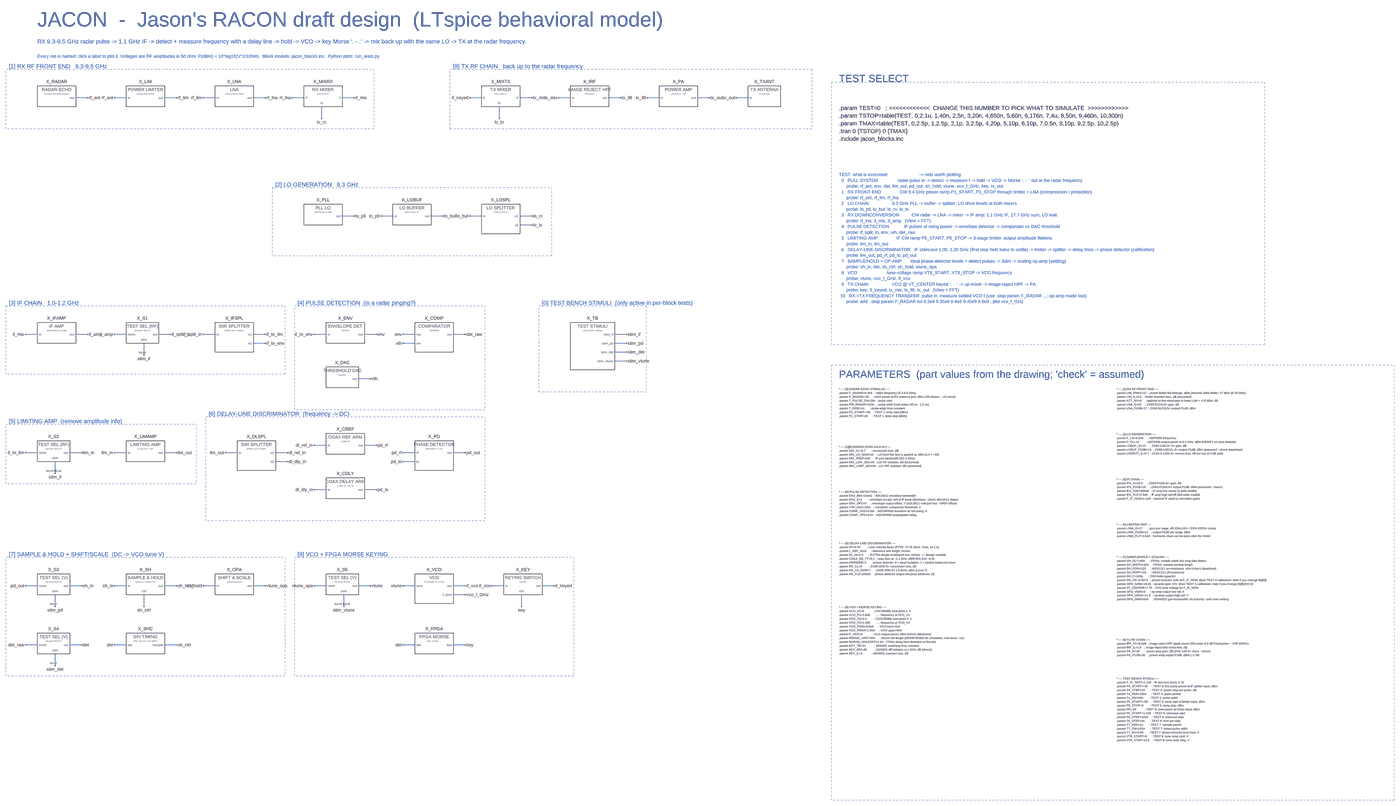
[diagram p0: schematic JACON_system.asc, whole sheet]
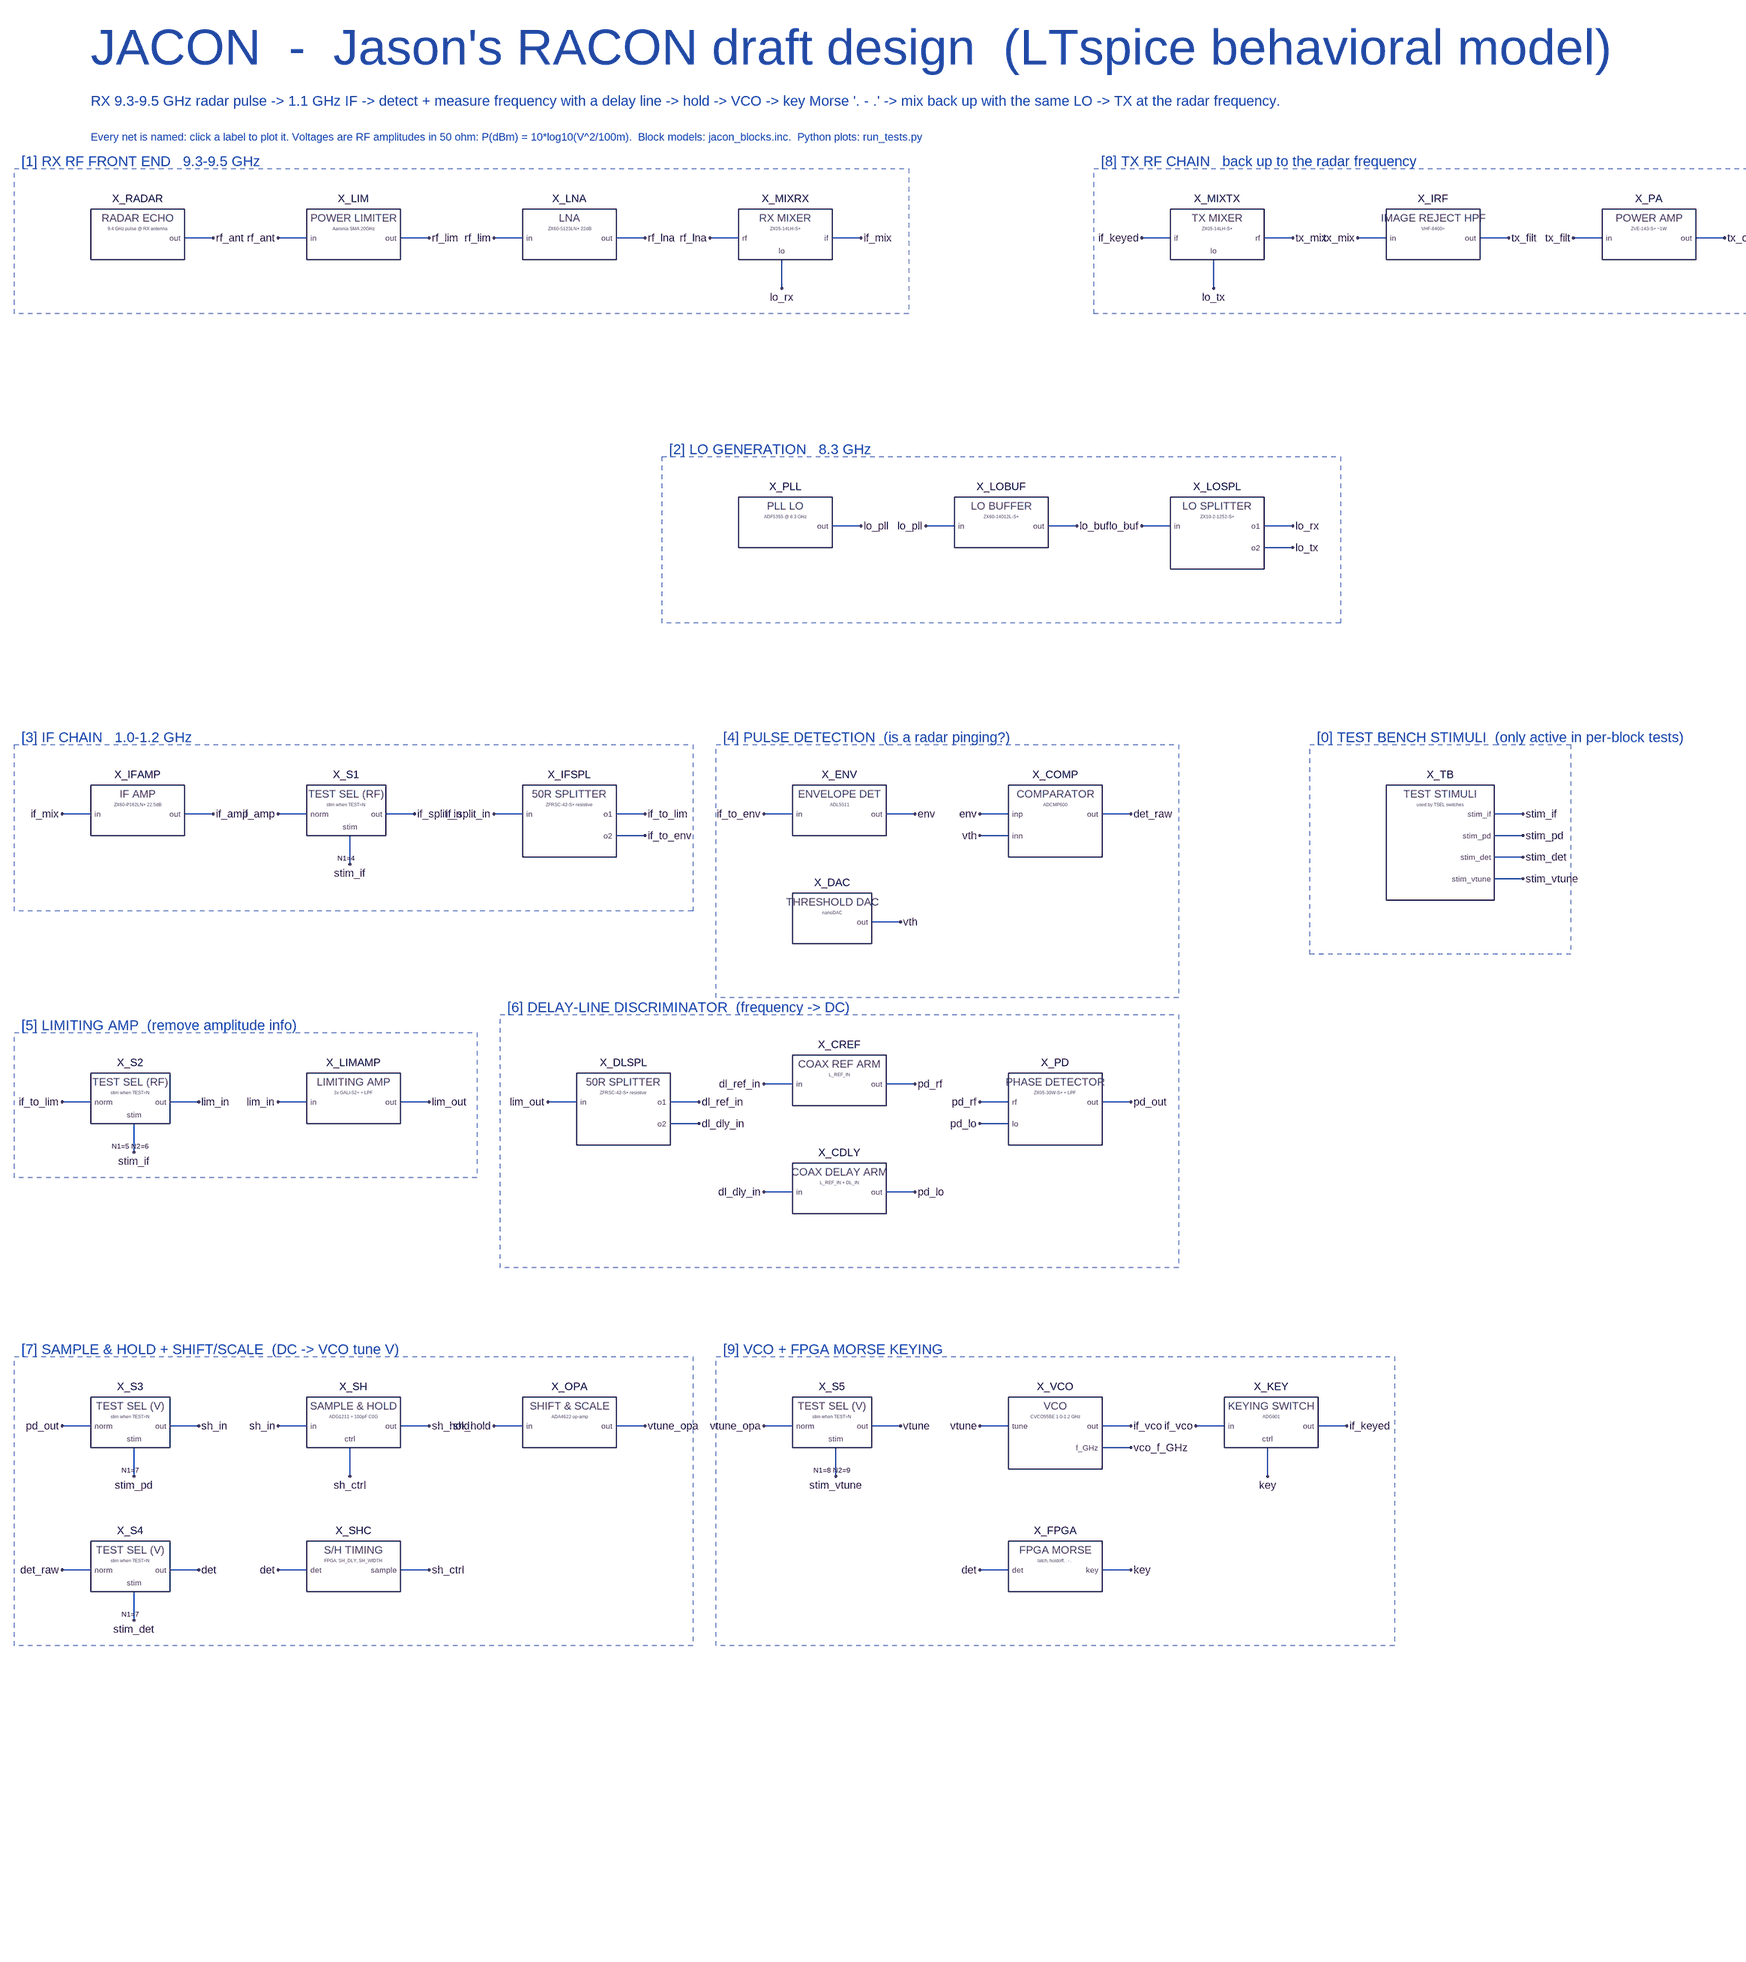
[diagram p1: schematic JACON_system.asc, part, row 1 of 1, column 1 of 2]
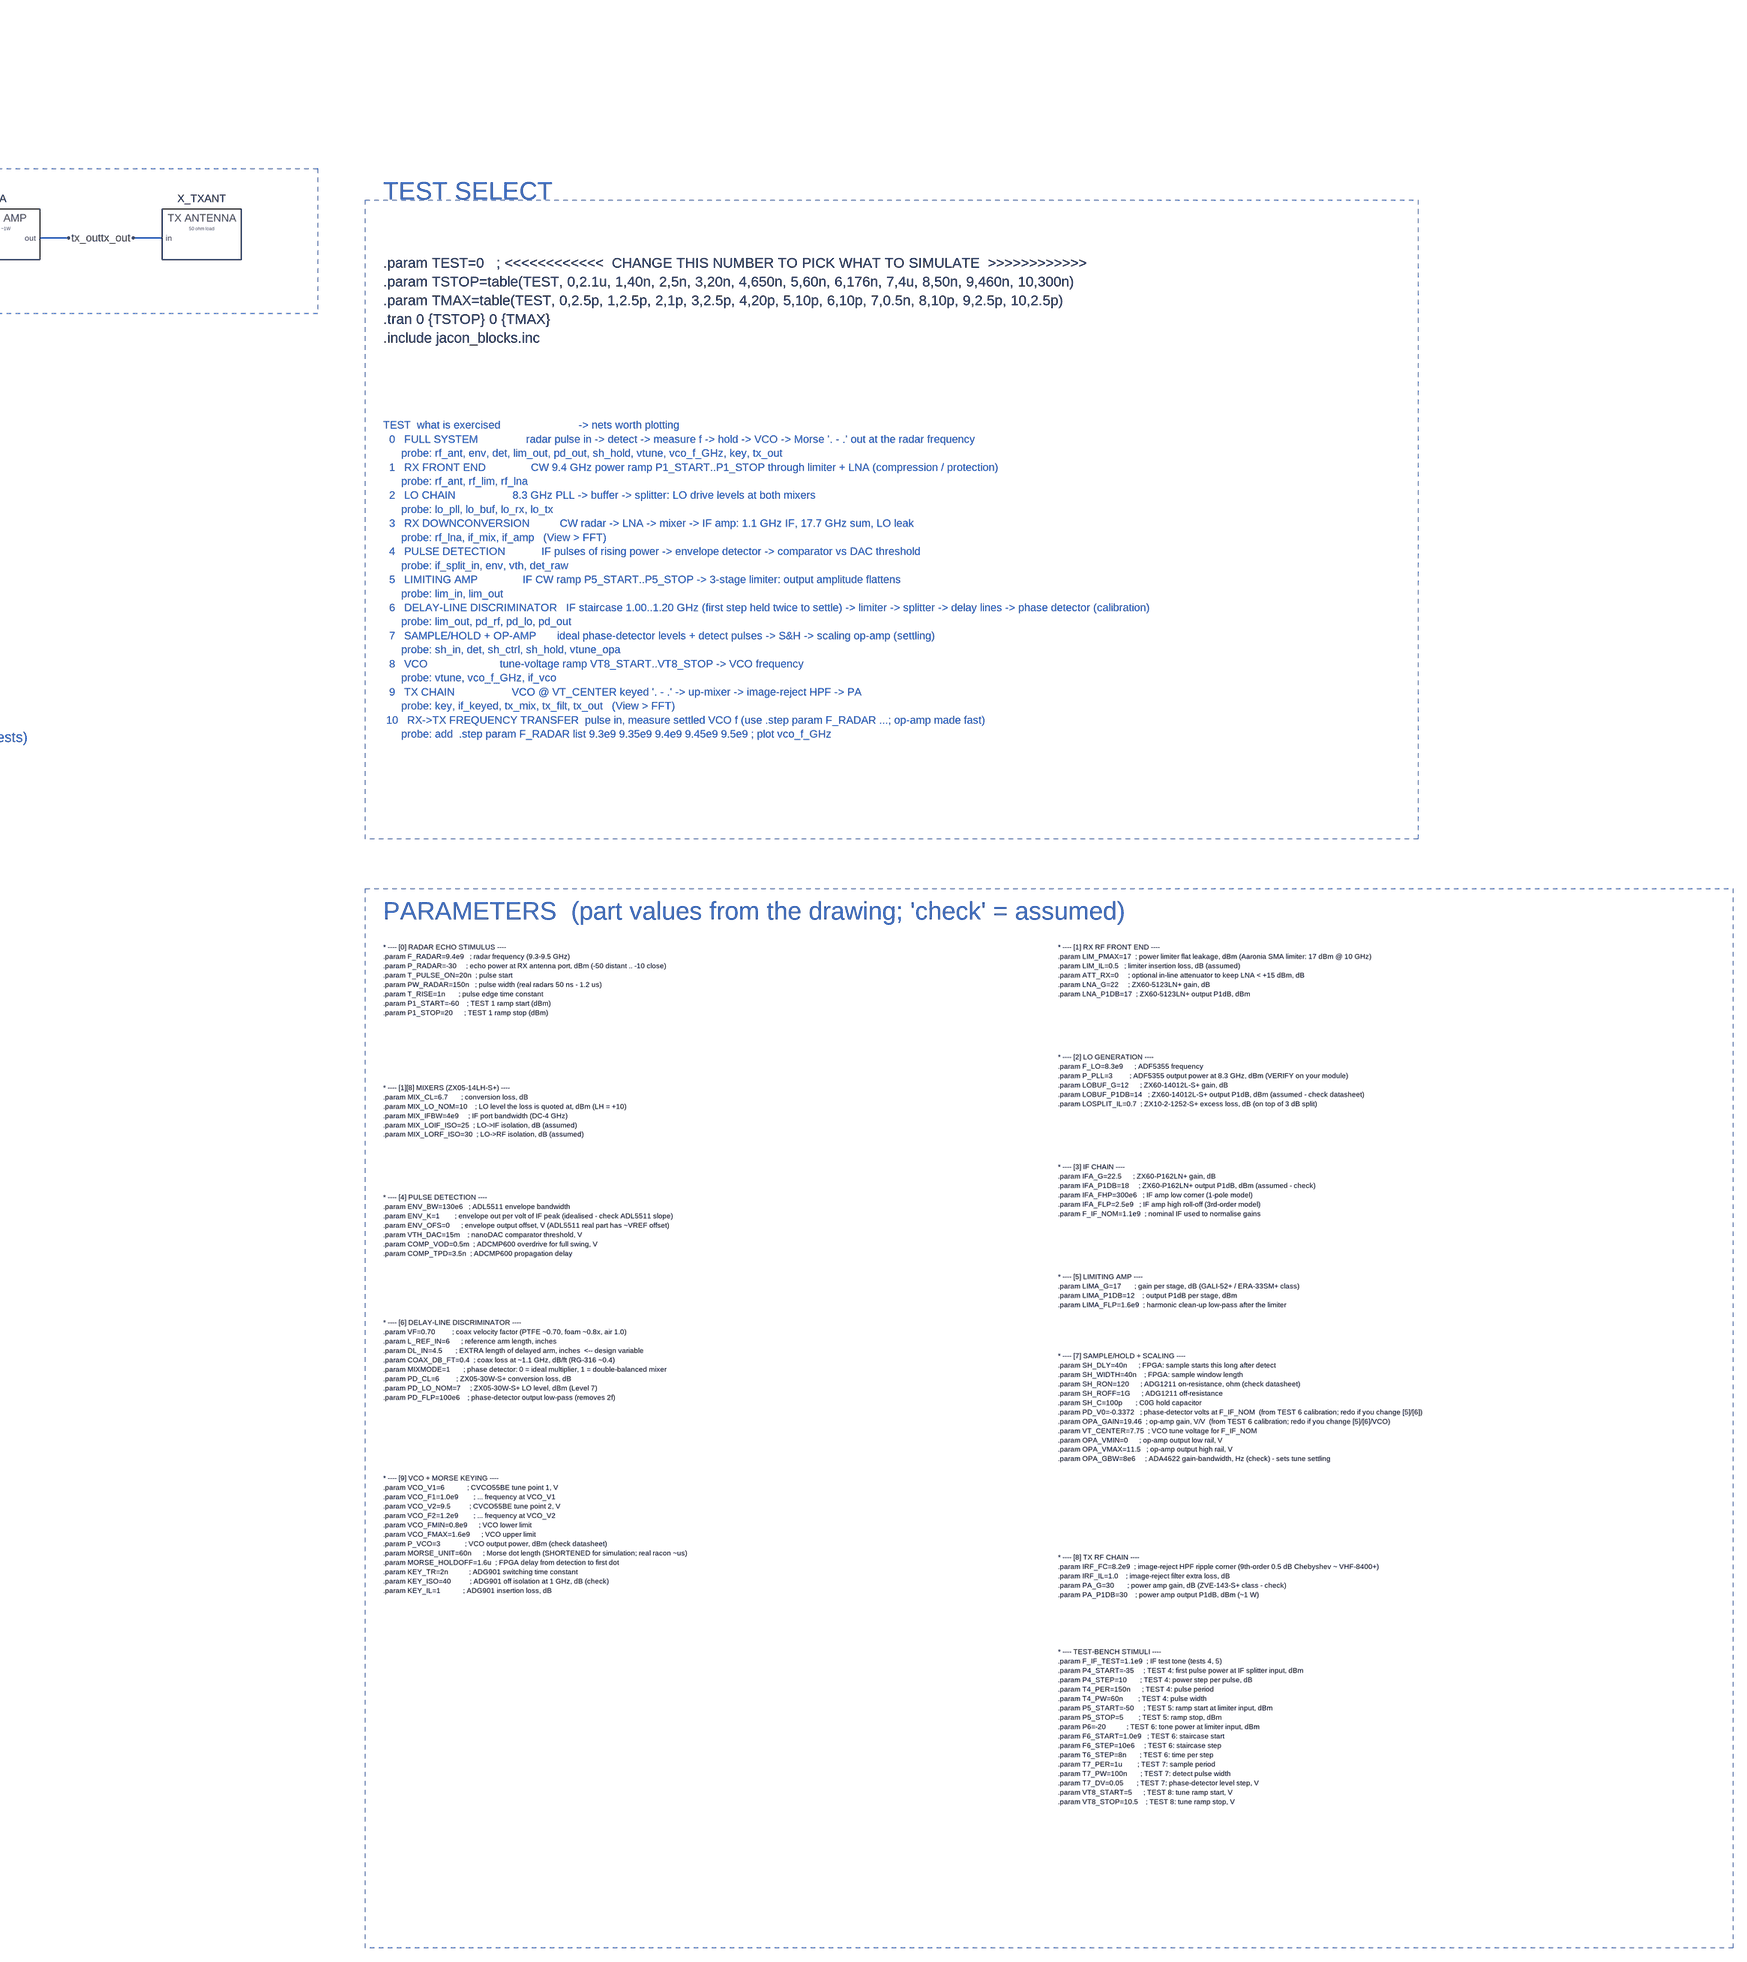
[diagram p2: schematic JACON_system.asc, part, row 1 of 1, column 2 of 2]
JACON_system.asc, the LTspice schematic file:
Version 4
SHEET 1 6400 4400
WIRE 272 64 208 64
FLAG 272 64 rf_ant
SYMBOL jacon_radar_src 0 0 R0
SYMATTR InstName X_RADAR
WIRE 416 64 480 64
FLAG 416 64 rf_ant
WIRE 752 64 688 64
FLAG 752 64 rf_lim
SYMBOL jacon_limiter 480 0 R0
SYMATTR InstName X_LIM
WIRE 896 64 960 64
FLAG 896 64 rf_lim
WIRE 1232 64 1168 64
FLAG 1232 64 rf_lna
SYMBOL jacon_lna 960 0 R0
SYMATTR InstName X_LNA
WIRE 1376 64 1440 64
FLAG 1376 64 rf_lna
WIRE 1712 64 1648 64
FLAG 1712 64 if_mix
WIRE 1536 176 1536 112
FLAG 1536 176 lo_rx
SYMBOL jacon_mix_down 1440 0 R0
SYMATTR InstName X_MIXRX
WIRE 2336 64 2400 64
FLAG 2336 64 if_keyed
WIRE 2672 64 2608 64
FLAG 2672 64 tx_mix
WIRE 2496 176 2496 112
FLAG 2496 176 lo_tx
SYMBOL jacon_mix_up 2400 0 R0
SYMATTR InstName X_MIXTX
WIRE 2816 64 2880 64
FLAG 2816 64 tx_mix
WIRE 3152 64 3088 64
FLAG 3152 64 tx_filt
SYMBOL jacon_img_rej 2880 0 R0
SYMATTR InstName X_IRF
WIRE 3296 64 3360 64
FLAG 3296 64 tx_filt
WIRE 3632 64 3568 64
FLAG 3632 64 tx_out
SYMBOL jacon_pa 3360 0 R0
SYMATTR InstName X_PA
WIRE 3776 64 3840 64
FLAG 3776 64 tx_out
SYMBOL jacon_tx_ant 3840 0 R0
SYMATTR InstName X_TXANT
WIRE 1712 704 1648 704
FLAG 1712 704 lo_pll
SYMBOL jacon_pll_lo 1440 640 R0
SYMATTR InstName X_PLL
WIRE 1856 704 1920 704
FLAG 1856 704 lo_pll
WIRE 2192 704 2128 704
FLAG 2192 704 lo_buf
SYMBOL jacon_lo_buf 1920 640 R0
SYMATTR InstName X_LOBUF
WIRE 2336 704 2400 704
FLAG 2336 704 lo_buf
WIRE 2672 704 2608 704
FLAG 2672 704 lo_rx
WIRE 2672 752 2608 752
FLAG 2672 752 lo_tx
SYMBOL jacon_split_lo 2400 640 R0
SYMATTR InstName X_LOSPL
WIRE -64 1344 0 1344
FLAG -64 1344 if_mix
WIRE 272 1344 208 1344
FLAG 272 1344 if_amp
SYMBOL jacon_if_amp 0 1280 R0
SYMATTR InstName X_IFAMP
WIRE 416 1344 480 1344
FLAG 416 1344 if_amp
WIRE 720 1344 656 1344
FLAG 720 1344 if_split_in
WIRE 576 1456 576 1392
FLAG 576 1456 stim_if
SYMBOL jacon_tsel_rf 480 1280 R0
SYMATTR InstName X_S1
SYMATTR SpiceLine N1=4
WIRE 896 1344 960 1344
FLAG 896 1344 if_split_in
WIRE 1232 1344 1168 1344
FLAG 1232 1344 if_to_lim
WIRE 1232 1392 1168 1392
FLAG 1232 1392 if_to_env
SYMBOL jacon_split_res 960 1280 R0
SYMATTR InstName X_IFSPL
WIRE 1496 1344 1560 1344
FLAG 1496 1344 if_to_env
WIRE 1832 1344 1768 1344
FLAG 1832 1344 env
SYMBOL jacon_env_det 1560 1280 R0
SYMATTR InstName X_ENV
WIRE 1800 1584 1736 1584
FLAG 1800 1584 vth
SYMBOL jacon_dac 1560 1520 R0
SYMATTR InstName X_DAC
WIRE 1976 1344 2040 1344
FLAG 1976 1344 env
WIRE 1976 1392 2040 1392
FLAG 1976 1392 vth
WIRE 2312 1344 2248 1344
FLAG 2312 1344 det_raw
SYMBOL jacon_comparator 2040 1280 R0
SYMATTR InstName X_COMP
WIRE 3184 1344 3120 1344
FLAG 3184 1344 stim_if
WIRE 3184 1392 3120 1392
FLAG 3184 1392 stim_pd
WIRE 3184 1440 3120 1440
FLAG 3184 1440 stim_det
WIRE 3184 1488 3120 1488
FLAG 3184 1488 stim_vtune
SYMBOL jacon_testbench 2880 1280 R0
SYMATTR InstName X_TB
WIRE -64 1984 0 1984
FLAG -64 1984 if_to_lim
WIRE 240 1984 176 1984
FLAG 240 1984 lim_in
WIRE 96 2096 96 2032
FLAG 96 2096 stim_if
SYMBOL jacon_tsel_rf 0 1920 R0
SYMATTR InstName X_S2
SYMATTR SpiceLine N1=5 N2=6
WIRE 416 1984 480 1984
FLAG 416 1984 lim_in
WIRE 752 1984 688 1984
FLAG 752 1984 lim_out
SYMBOL jacon_lim_amp 480 1920 R0
SYMATTR InstName X_LIMAMP
WIRE 1016 1984 1080 1984
FLAG 1016 1984 lim_out
WIRE 1352 1984 1288 1984
FLAG 1352 1984 dl_ref_in
WIRE 1352 2032 1288 2032
FLAG 1352 2032 dl_dly_in
SYMBOL jacon_split_res 1080 1920 R0
SYMATTR InstName X_DLSPL
WIRE 1496 1944 1560 1944
FLAG 1496 1944 dl_ref_in
WIRE 1832 1944 1768 1944
FLAG 1832 1944 pd_rf
SYMBOL jacon_coax_ref 1560 1880 R0
SYMATTR InstName X_CREF
WIRE 1496 2184 1560 2184
FLAG 1496 2184 dl_dly_in
WIRE 1832 2184 1768 2184
FLAG 1832 2184 pd_lo
SYMBOL jacon_coax_dly 1560 2120 R0
SYMATTR InstName X_CDLY
WIRE 1976 1984 2040 1984
FLAG 1976 1984 pd_rf
WIRE 1976 2032 2040 2032
FLAG 1976 2032 pd_lo
WIRE 2312 1984 2248 1984
FLAG 2312 1984 pd_out
SYMBOL jacon_phase_det 2040 1920 R0
SYMATTR InstName X_PD
WIRE -64 2704 0 2704
FLAG -64 2704 pd_out
WIRE 240 2704 176 2704
FLAG 240 2704 sh_in
WIRE 96 2816 96 2752
FLAG 96 2816 stim_pd
SYMBOL jacon_tsel_v 0 2640 R0
SYMATTR InstName X_S3
SYMATTR SpiceLine N1=7
WIRE -64 3024 0 3024
FLAG -64 3024 det_raw
WIRE 240 3024 176 3024
FLAG 240 3024 det
WIRE 96 3136 96 3072
FLAG 96 3136 stim_det
SYMBOL jacon_tsel_v 0 2960 R0
SYMATTR InstName X_S4
SYMATTR SpiceLine N1=7
WIRE 416 3024 480 3024
FLAG 416 3024 det
WIRE 752 3024 688 3024
FLAG 752 3024 sh_ctrl
SYMBOL jacon_sh_ctrl 480 2960 R0
SYMATTR InstName X_SHC
WIRE 416 2704 480 2704
FLAG 416 2704 sh_in
WIRE 752 2704 688 2704
FLAG 752 2704 sh_hold
WIRE 576 2816 576 2752
FLAG 576 2816 sh_ctrl
SYMBOL jacon_sample_hold 480 2640 R0
SYMATTR InstName X_SH
WIRE 896 2704 960 2704
FLAG 896 2704 sh_hold
WIRE 1232 2704 1168 2704
FLAG 1232 2704 vtune_opa
SYMBOL jacon_opamp_scale 960 2640 R0
SYMATTR InstName X_OPA
WIRE 1496 2704 1560 2704
FLAG 1496 2704 vtune_opa
WIRE 1800 2704 1736 2704
FLAG 1800 2704 vtune
WIRE 1656 2816 1656 2752
FLAG 1656 2816 stim_vtune
SYMBOL jacon_tsel_v 1560 2640 R0
SYMATTR InstName X_S5
SYMATTR SpiceLine N1=8 N2=9
WIRE 1976 2704 2040 2704
FLAG 1976 2704 vtune
WIRE 2312 2704 2248 2704
FLAG 2312 2704 if_vco
WIRE 2312 2752 2248 2752
FLAG 2312 2752 vco_f_GHz
SYMBOL jacon_vco 2040 2640 R0
SYMATTR InstName X_VCO
WIRE 1976 3024 2040 3024
FLAG 1976 3024 det
WIRE 2312 3024 2248 3024
FLAG 2312 3024 key
SYMBOL jacon_fpga_morse 2040 2960 R0
SYMATTR InstName X_FPGA
WIRE 2456 2704 2520 2704
FLAG 2456 2704 if_vco
WIRE 2792 2704 2728 2704
FLAG 2792 2704 if_keyed
WIRE 2616 2816 2616 2752
FLAG 2616 2816 key
SYMBOL jacon_key_sw 2520 2640 R0
SYMATTR InstName X_KEY
RECTANGLE Normal 1818 232 -170 -90 2
TEXT -154 -106 Left 3 ;[1] RX RF FRONT END   9.3-9.5 GHz
RECTANGLE Normal 4186 232 2230 -90 2
TEXT 2246 -106 Left 3 ;[8] TX RF CHAIN   back up to the radar frequency
RECTANGLE Normal 2778 920 1270 550 2
TEXT 1286 534 Left 3 ;[2] LO GENERATION   8.3 GHz
RECTANGLE Normal 1338 1560 -170 1190 2
TEXT -154 1174 Left 3 ;[3] IF CHAIN   1.0-1.2 GHz
RECTANGLE Normal 2418 1752 1390 1190 2
TEXT 1406 1174 Left 3 ;[4] PULSE DETECTION  (is a radar pinging?)
RECTANGLE Normal 3290 1656 2710 1190 2
TEXT 2726 1174 Left 3 ;[0] TEST BENCH STIMULI  (only active in per-block tests)
RECTANGLE Normal 858 2152 -170 1830 2
TEXT -154 1814 Left 3 ;[5] LIMITING AMP  (remove amplitude info)
RECTANGLE Normal 2418 2352 910 1790 2
TEXT 926 1774 Left 3 ;[6] DELAY-LINE DISCRIMINATOR  (frequency -> DC)
RECTANGLE Normal 1338 3192 -170 2550 2
TEXT -154 2534 Left 3 ;[7] SAMPLE & HOLD + SHIFT/SCALE  (DC -> VCO tune V)
RECTANGLE Normal 2898 3192 1390 2550 2
TEXT 1406 2534 Left 3 ;[9] VCO + FPGA MORSE KEYING
TEXT 0 -360 Left 7 ;JACON  -  Jason's RACON draft design  (LTspice behavioral model)
TEXT 0 -240 Left 3 ;RX 9.3-9.5 GHz radar pulse -> 1.1 GHz IF -> detect + measure frequency with a delay line -> hold -> VCO -> key Morse '. - .' -> mix back up with the same LO -> TX at the radar frequency.
TEXT 0 -160 Left 2 ;Every net is named: click a label to plot it. Voltages are RF amplitudes in 50 ohm: P(dBm) = 10*log10(V^2/100m).  Block models: jacon_blocks.inc.  Python plots: run_tests.py
TEXT 4400 120 Left 3 !.param TEST=0   ; <<<<<<<<<<<<  CHANGE THIS NUMBER TO PICK WHAT TO SIMULATE  >>>>>>>>>>>>\n.param TSTOP=table(TEST, 0,2.1u, 1,40n, 2,5n, 3,20n, 4,650n, 5,60n, 6,176n, 7,4u, 8,50n, 9,460n, 10,300n)\n.param TMAX=table(TEST, 0,2.5p, 1,2.5p, 2,1p, 3,2.5p, 4,20p, 5,10p, 6,10p, 7,0.5n, 8,10p, 9,2.5p, 10,2.5p)\n.tran 0 {TSTOP} 0 {TMAX}\n.include jacon_blocks.inc
TEXT 4400 480 Left 2 ;TEST  what is exercised                          -> nets worth plotting\n  0   FULL SYSTEM                radar pulse in -> detect -> measure f -> hold -> VCO -> Morse '. - .' out at the radar frequency\n      probe: rf_ant, env, det, lim_out, pd_out, sh_hold, vtune, vco_f_GHz, key, tx_out\n  1   RX FRONT END               CW 9.4 GHz power ramp P1_START..P1_STOP through limiter + LNA (compression / protection)\n      probe: rf_ant, rf_lim, rf_lna\n  2   LO CHAIN                   8.3 GHz PLL -> buffer -> splitter: LO drive levels at both mixers\n      probe: lo_pll, lo_buf, lo_rx, lo_tx\n  3   RX DOWNCONVERSION          CW radar -> LNA -> mixer -> IF amp: 1.1 GHz IF, 17.7 GHz sum, LO leak\n      probe: rf_lna, if_mix, if_amp   (View > FFT)\n  4   PULSE DETECTION            IF pulses of rising power -> envelope detector -> comparator vs DAC threshold\n      probe: if_split_in, env, vth, det_raw\n  5   LIMITING AMP               IF CW ramp P5_START..P5_STOP -> 3-stage limiter: output amplitude flattens\n      probe: lim_in, lim_out\n  6   DELAY-LINE DISCRIMINATOR   IF staircase 1.00..1.20 GHz (first step held twice to settle) -> limiter -> splitter -> delay lines -> phase detector (calibration)\n      probe: lim_out, pd_rf, pd_lo, pd_out\n  7   SAMPLE/HOLD + OP-AMP       ideal phase-detector levels + detect pulses -> S&H -> scaling op-amp (settling)\n      probe: sh_in, det, sh_ctrl, sh_hold, vtune_opa\n  8   VCO                        tune-voltage ramp VT8_START..VT8_STOP -> VCO frequency\n      probe: vtune, vco_f_GHz, if_vco\n  9   TX CHAIN                   VCO @ VT_CENTER keyed '. - .' -> up-mixer -> image-reject HPF -> PA\n      probe: key, if_keyed, tx_mix, tx_filt, tx_out   (View > FFT)\n 10   RX->TX FREQUENCY TRANSFER  pulse in, measure settled VCO f (use .step param F_RADAR ...; op-amp made fast)\n      probe: add  .step param F_RADAR list 9.3e9 9.35e9 9.4e9 9.45e9 9.5e9 ; plot vco_f_GHz
RECTANGLE Normal 6700 1400 4360 -20 2
TEXT 4400 -40 Left 5 ;TEST SELECT
TEXT 4400 1560 Left 5 ;PARAMETERS  (part values from the drawing; 'check' = assumed)
TEXT 4400 1640 Left 1 !* ---- [0] RADAR ECHO STIMULUS ----\n.param F_RADAR=9.4e9   ; radar frequency (9.3-9.5 GHz)\n.param P_RADAR=-30     ; echo power at RX antenna port, dBm (-50 distant .. -10 close)\n.param T_PULSE_ON=20n  ; pulse start\n.param PW_RADAR=150n   ; pulse width (real radars 50 ns - 1.2 us)\n.param T_RISE=1n       ; pulse edge time constant\n.param P1_START=-60    ; TEST 1 ramp start (dBm)\n.param P1_STOP=20      ; TEST 1 ramp stop (dBm)
TEXT 5900 1640 Left 1 !* ---- [1] RX RF FRONT END ----\n.param LIM_PMAX=17  ; power limiter flat leakage, dBm (Aaronia SMA limiter: 17 dBm @ 10 GHz)\n.param LIM_IL=0.5   ; limiter insertion loss, dB (assumed)\n.param ATT_RX=0     ; optional in-line attenuator to keep LNA < +15 dBm, dB\n.param LNA_G=22     ; ZX60-5123LN+ gain, dB\n.param LNA_P1DB=17  ; ZX60-5123LN+ output P1dB, dBm
TEXT 5900 1884 Left 1 !* ---- [2] LO GENERATION ----\n.param F_LO=8.3e9      ; ADF5355 frequency\n.param P_PLL=3         ; ADF5355 output power at 8.3 GHz, dBm (VERIFY on your module)\n.param LOBUF_G=12      ; ZX60-14012L-S+ gain, dB\n.param LOBUF_P1DB=14   ; ZX60-14012L-S+ output P1dB, dBm (assumed - check datasheet)\n.param LOSPLIT_IL=0.7  ; ZX10-2-1252-S+ excess loss, dB (on top of 3 dB split)
TEXT 4400 1952 Left 1 !* ---- [1][8] MIXERS (ZX05-14LH-S+) ----\n.param MIX_CL=6.7       ; conversion loss, dB\n.param MIX_LO_NOM=10    ; LO level the loss is quoted at, dBm (LH = +10)\n.param MIX_IFBW=4e9     ; IF port bandwidth (DC-4 GHz)\n.param MIX_LOIF_ISO=25  ; LO->IF isolation, dB (assumed)\n.param MIX_LORF_ISO=30  ; LO->RF isolation, dB (assumed)
TEXT 5900 2128 Left 1 !* ---- [3] IF CHAIN ----\n.param IFA_G=22.5      ; ZX60-P162LN+ gain, dB\n.param IFA_P1DB=18     ; ZX60-P162LN+ output P1dB, dBm (assumed - check)\n.param IFA_FHP=300e6   ; IF amp low corner (1-pole model)\n.param IFA_FLP=2.5e9   ; IF amp high roll-off (3rd-order model)\n.param F_IF_NOM=1.1e9  ; nominal IF used to normalise gains
TEXT 4400 2196 Left 1 !* ---- [4] PULSE DETECTION ----\n.param ENV_BW=130e6   ; ADL5511 envelope bandwidth\n.param ENV_K=1        ; envelope out per volt of IF peak (idealised - check ADL5511 slope)\n.param ENV_OFS=0      ; envelope output offset, V (ADL5511 real part has ~VREF offset)\n.param VTH_DAC=15m    ; nanoDAC comparator threshold, V\n.param COMP_VOD=0.5m  ; ADCMP600 overdrive for full swing, V\n.param COMP_TPD=3.5n  ; ADCMP600 propagation delay
TEXT 5900 2372 Left 1 !* ---- [5] LIMITING AMP ----\n.param LIMA_G=17       ; gain per stage, dB (GALI-52+ / ERA-33SM+ class)\n.param LIMA_P1DB=12    ; output P1dB per stage, dBm\n.param LIMA_FLP=1.6e9  ; harmonic clean-up low-pass after the limiter
TEXT 4400 2474 Left 1 !* ---- [6] DELAY-LINE DISCRIMINATOR ----\n.param VF=0.70         ; coax velocity factor (PTFE ~0.70, foam ~0.8x, air 1.0)\n.param L_REF_IN=6      ; reference arm length, inches\n.param DL_IN=4.5       ; EXTRA length of delayed arm, inches  <-- design variable\n.param COAX_DB_FT=0.4  ; coax loss at ~1.1 GHz, dB/ft (RG-316 ~0.4)\n.param MIXMODE=1       ; phase detector: 0 = ideal multiplier, 1 = double-balanced mixer\n.param PD_CL=6         ; ZX05-30W-S+ conversion loss, dB\n.param PD_LO_NOM=7     ; ZX05-30W-S+ LO level, dBm (Level 7)\n.param PD_FLP=100e6    ; phase-detector output low-pass (removes 2f)
TEXT 5900 2548 Left 1 !* ---- [7] SAMPLE/HOLD + SCALING ----\n.param SH_DLY=40n      ; FPGA: sample starts this long after detect\n.param SH_WIDTH=40n    ; FPGA: sample window length\n.param SH_RON=120      ; ADG1211 on-resistance, ohm (check datasheet)\n.param SH_ROFF=1G      ; ADG1211 off-resistance\n.param SH_C=100p       ; C0G hold capacitor\n.param PD_V0=-0.3372   ; phase-detector volts at F_IF_NOM  (from TEST 6 calibration; redo if you change [5]/[6])\n.param OPA_GAIN=19.46  ; op-amp gain, V/V  (from TEST 6 calibration; redo if you change [5]/[6]/VCO)\n.param VT_CENTER=7.75  ; VCO tune voltage for F_IF_NOM\n.param OPA_VMIN=0      ; op-amp output low rail, V\n.param OPA_VMAX=11.5   ; op-amp output high rail, V\n.param OPA_GBW=8e6     ; ADA4622 gain-bandwidth, Hz (check) - sets tune settling
TEXT 4400 2820 Left 1 !* ---- [9] VCO + MORSE KEYING ----\n.param VCO_V1=6            ; CVCO55BE tune point 1, V\n.param VCO_F1=1.0e9        ; ... frequency at VCO_V1\n.param VCO_V2=9.5          ; CVCO55BE tune point 2, V\n.param VCO_F2=1.2e9        ; ... frequency at VCO_V2\n.param VCO_FMIN=0.8e9      ; VCO lower limit\n.param VCO_FMAX=1.6e9      ; VCO upper limit\n.param P_VCO=3             ; VCO output power, dBm (check datasheet)\n.param MORSE_UNIT=60n      ; Morse dot length (SHORTENED for simulation; real racon ~us)\n.param MORSE_HOLDOFF=1.6u  ; FPGA delay from detection to first dot\n.param KEY_TR=2n           ; ADG901 switching time constant\n.param KEY_ISO=40          ; ADG901 off isolation at 1 GHz, dB (check)\n.param KEY_IL=1            ; ADG901 insertion loss, dB
TEXT 5900 2996 Left 1 !* ---- [8] TX RF CHAIN ----\n.param IRF_FC=8.2e9  ; image-reject HPF ripple corner (9th-order 0.5 dB Chebyshev ~ VHF-8400+)\n.param IRF_IL=1.0    ; image-reject filter extra loss, dB\n.param PA_G=30       ; power amp gain, dB (ZVE-143-S+ class - check)\n.param PA_P1DB=30    ; power amp output P1dB, dBm (~1 W)
TEXT 5900 3206 Left 1 !* ---- TEST-BENCH STIMULI ----\n.param F_IF_TEST=1.1e9  ; IF test tone (tests 4, 5)\n.param P4_START=-35     ; TEST 4: first pulse power at IF splitter input, dBm\n.param P4_STEP=10       ; TEST 4: power step per pulse, dB\n.param T4_PER=150n      ; TEST 4: pulse period\n.param T4_PW=60n        ; TEST 4: pulse width\n.param P5_START=-50     ; TEST 5: ramp start at limiter input, dBm\n.param P5_STOP=5        ; TEST 5: ramp stop, dBm\n.param P6=-20           ; TEST 6: tone power at limiter input, dBm\n.param F6_START=1.0e9   ; TEST 6: staircase start\n.param F6_STEP=10e6     ; TEST 6: staircase step\n.param T6_STEP=8n       ; TEST 6: time per step\n.param T7_PER=1u        ; TEST 7: sample period\n.param T7_PW=100n       ; TEST 7: detect pulse width\n.param T7_DV=0.05       ; TEST 7: phase-detector level step, V\n.param VT8_START=5      ; TEST 8: tune ramp start, V\n.param VT8_STOP=10.5    ; TEST 8: tune ramp stop, V
RECTANGLE Normal 7400 3864 4360 1510 2

The netlist it stands for:
* JACON_system.asc
XX_RADAR rf_ant RADAR_SRC  ; pins out
XX_LIM rf_ant rf_lim LIMITER  ; pins in out
XX_LNA rf_lim rf_lna LNA  ; pins in out
XX_MIXRX rf_lna lo_rx if_mix MIX_DOWN  ; pins rf lo if
XX_MIXTX if_keyed lo_tx tx_mix MIX_UP  ; pins if lo rf
XX_IRF tx_mix tx_filt IMG_REJ  ; pins in out
XX_PA tx_filt tx_out PA  ; pins in out
XX_TXANT tx_out TX_ANT  ; pins in
XX_PLL lo_pll PLL_LO  ; pins out
XX_LOBUF lo_pll lo_buf LO_BUF  ; pins in out
XX_LOSPL lo_buf lo_rx lo_tx SPLIT_LO  ; pins in o1 o2
XX_IFAMP if_mix if_amp IF_AMP  ; pins in out
XX_S1 if_amp stim_if if_split_in TSEL_RF N1=4  ; pins norm stim out
XX_IFSPL if_split_in if_to_lim if_to_env SPLIT_RES  ; pins in o1 o2
XX_ENV if_to_env env ENV_DET  ; pins in out
XX_DAC vth DAC  ; pins out
XX_COMP env vth det_raw COMPARATOR  ; pins inp inn out
XX_TB stim_if stim_pd stim_det stim_vtune TESTBENCH  ; pins stim_if stim_pd stim_det stim_vtune
XX_S2 if_to_lim stim_if lim_in TSEL_RF N1=5 N2=6  ; pins norm stim out
XX_LIMAMP lim_in lim_out LIM_AMP  ; pins in out
XX_DLSPL lim_out dl_ref_in dl_dly_in SPLIT_RES  ; pins in o1 o2
XX_CREF dl_ref_in pd_rf COAX_REF  ; pins in out
XX_CDLY dl_dly_in pd_lo COAX_DLY  ; pins in out
XX_PD pd_rf pd_lo pd_out PHASE_DET  ; pins rf lo out
XX_S3 pd_out stim_pd sh_in TSEL_V N1=7  ; pins norm stim out
XX_S4 det_raw stim_det det TSEL_V N1=7  ; pins norm stim out
XX_SHC det sh_ctrl SH_CTRL  ; pins det sample
XX_SH sh_in sh_ctrl sh_hold SAMPLE_HOLD  ; pins in ctrl out
XX_OPA sh_hold vtune_opa OPAMP_SCALE  ; pins in out
XX_S5 vtune_opa stim_vtune vtune TSEL_V N1=8 N2=9  ; pins norm stim out
XX_VCO vtune if_vco vco_f_GHz VCO  ; pins tune out f_GHz
XX_FPGA det key FPGA_MORSE  ; pins det key
XX_KEY if_vco key if_keyed KEY_SW  ; pins in ctrl out
* [1] RX RF FRONT END   9.3-9.5 GHz
* [8] TX RF CHAIN   back up to the radar frequency
* [2] LO GENERATION   8.3 GHz
* [3] IF CHAIN   1.0-1.2 GHz
* [4] PULSE DETECTION  (is a radar pinging?)
* [0] TEST BENCH STIMULI  (only active in per-block tests)
* [5] LIMITING AMP  (remove amplitude info)
* [6] DELAY-LINE DISCRIMINATOR  (frequency -> DC)
* [7] SAMPLE & HOLD + SHIFT/SCALE  (DC -> VCO tune V)
* [9] VCO + FPGA MORSE KEYING
* JACON  -  Jason's RACON draft design  (LTspice behavioral model)
* RX 9.3-9.5 GHz radar pulse -> 1.1 GHz IF -> detect + measure frequency with a delay line -> hold -> VCO -> key Morse '. - .' -> mix back up with the same LO -> TX at the radar frequency.
* Every net is named: click a label to plot it. Voltages are RF amplitudes in 50 ohm: P(dBm) = 10*log10(V^2/100m).  Block models: jacon_blocks.inc.  Python plots: run_tests.py
.param TEST=0   ; <<<<<<<<<<<<  CHANGE THIS NUMBER TO PICK WHAT TO SIMULATE  >>>>>>>>>>>>
.param TSTOP=table(TEST, 0,2.1u, 1,40n, 2,5n, 3,20n, 4,650n, 5,60n, 6,176n, 7,4u, 8,50n, 9,460n, 10,300n)
.param TMAX=table(TEST, 0,2.5p, 1,2.5p, 2,1p, 3,2.5p, 4,20p, 5,10p, 6,10p, 7,0.5n, 8,10p, 9,2.5p, 10,2.5p)
.tran 0 {TSTOP} 0 {TMAX}
.include jacon_blocks.inc
* TEST  what is exercised                          -> nets worth plotting
*   0   FULL SYSTEM                radar pulse in -> detect -> measure f -> hold -> VCO -> Morse '. - .' out at the radar frequency
*       probe: rf_ant, env, det, lim_out, pd_out, sh_hold, vtune, vco_f_GHz, key, tx_out
*   1   RX FRONT END               CW 9.4 GHz power ramp P1_START..P1_STOP through limiter + LNA (compression / protection)
*       probe: rf_ant, rf_lim, rf_lna
*   2   LO CHAIN                   8.3 GHz PLL -> buffer -> splitter: LO drive levels at both mixers
*       probe: lo_pll, lo_buf, lo_rx, lo_tx
*   3   RX DOWNCONVERSION          CW radar -> LNA -> mixer -> IF amp: 1.1 GHz IF, 17.7 GHz sum, LO leak
*       probe: rf_lna, if_mix, if_amp   (View > FFT)
*   4   PULSE DETECTION            IF pulses of rising power -> envelope detector -> comparator vs DAC threshold
*       probe: if_split_in, env, vth, det_raw
*   5   LIMITING AMP               IF CW ramp P5_START..P5_STOP -> 3-stage limiter: output amplitude flattens
*       probe: lim_in, lim_out
*   6   DELAY-LINE DISCRIMINATOR   IF staircase 1.00..1.20 GHz (first step held twice to settle) -> limiter -> splitter -> delay lines -> phase detector (calibration)
*       probe: lim_out, pd_rf, pd_lo, pd_out
*   7   SAMPLE/HOLD + OP-AMP       ideal phase-detector levels + detect pulses -> S&H -> scaling op-amp (settling)
*       probe: sh_in, det, sh_ctrl, sh_hold, vtune_opa
*   8   VCO                        tune-voltage ramp VT8_START..VT8_STOP -> VCO frequency
*       probe: vtune, vco_f_GHz, if_vco
*   9   TX CHAIN                   VCO @ VT_CENTER keyed '. - .' -> up-mixer -> image-reject HPF -> PA
*       probe: key, if_keyed, tx_mix, tx_filt, tx_out   (View > FFT)
*  10   RX->TX FREQUENCY TRANSFER  pulse in, measure settled VCO f (use .step param F_RADAR ...; op-amp made fast)
*       probe: add  .step param F_RADAR list 9.3e9 9.35e9 9.4e9 9.45e9 9.5e9 ; plot vco_f_GHz
* TEST SELECT
* PARAMETERS  (part values from the drawing; 'check' = assumed)
* ---- [0] RADAR ECHO STIMULUS ----
.param F_RADAR=9.4e9   ; radar frequency (9.3-9.5 GHz)
.param P_RADAR=-30     ; echo power at RX antenna port, dBm (-50 distant .. -10 close)
.param T_PULSE_ON=20n  ; pulse start
.param PW_RADAR=150n   ; pulse width (real radars 50 ns - 1.2 us)
.param T_RISE=1n       ; pulse edge time constant
.param P1_START=-60    ; TEST 1 ramp start (dBm)
.param P1_STOP=20      ; TEST 1 ramp stop (dBm)
* ---- [1] RX RF FRONT END ----
.param LIM_PMAX=17  ; power limiter flat leakage, dBm (Aaronia SMA limiter: 17 dBm @ 10 GHz)
.param LIM_IL=0.5   ; limiter insertion loss, dB (assumed)
.param ATT_RX=0     ; optional in-line attenuator to keep LNA < +15 dBm, dB
.param LNA_G=22     ; ZX60-5123LN+ gain, dB
.param LNA_P1DB=17  ; ZX60-5123LN+ output P1dB, dBm
* ---- [2] LO GENERATION ----
.param F_LO=8.3e9      ; ADF5355 frequency
.param P_PLL=3         ; ADF5355 output power at 8.3 GHz, dBm (VERIFY on your module)
.param LOBUF_G=12      ; ZX60-14012L-S+ gain, dB
.param LOBUF_P1DB=14   ; ZX60-14012L-S+ output P1dB, dBm (assumed - check datasheet)
.param LOSPLIT_IL=0.7  ; ZX10-2-1252-S+ excess loss, dB (on top of 3 dB split)
* ---- [1][8] MIXERS (ZX05-14LH-S+) ----
.param MIX_CL=6.7       ; conversion loss, dB
.param MIX_LO_NOM=10    ; LO level the loss is quoted at, dBm (LH = +10)
.param MIX_IFBW=4e9     ; IF port bandwidth (DC-4 GHz)
.param MIX_LOIF_ISO=25  ; LO->IF isolation, dB (assumed)
.param MIX_LORF_ISO=30  ; LO->RF isolation, dB (assumed)
* ---- [3] IF CHAIN ----
.param IFA_G=22.5      ; ZX60-P162LN+ gain, dB
.param IFA_P1DB=18     ; ZX60-P162LN+ output P1dB, dBm (assumed - check)
.param IFA_FHP=300e6   ; IF amp low corner (1-pole model)
.param IFA_FLP=2.5e9   ; IF amp high roll-off (3rd-order model)
.param F_IF_NOM=1.1e9  ; nominal IF used to normalise gains
* ---- [4] PULSE DETECTION ----
.param ENV_BW=130e6   ; ADL5511 envelope bandwidth
.param ENV_K=1        ; envelope out per volt of IF peak (idealised - check ADL5511 slope)
.param ENV_OFS=0      ; envelope output offset, V (ADL5511 real part has ~VREF offset)
.param VTH_DAC=15m    ; nanoDAC comparator threshold, V
.param COMP_VOD=0.5m  ; ADCMP600 overdrive for full swing, V
.param COMP_TPD=3.5n  ; ADCMP600 propagation delay
* ---- [5] LIMITING AMP ----
.param LIMA_G=17       ; gain per stage, dB (GALI-52+ / ERA-33SM+ class)
.param LIMA_P1DB=12    ; output P1dB per stage, dBm
.param LIMA_FLP=1.6e9  ; harmonic clean-up low-pass after the limiter
* ---- [6] DELAY-LINE DISCRIMINATOR ----
.param VF=0.70         ; coax velocity factor (PTFE ~0.70, foam ~0.8x, air 1.0)
.param L_REF_IN=6      ; reference arm length, inches
.param DL_IN=4.5       ; EXTRA length of delayed arm, inches  <-- design variable
.param COAX_DB_FT=0.4  ; coax loss at ~1.1 GHz, dB/ft (RG-316 ~0.4)
.param MIXMODE=1       ; phase detector: 0 = ideal multiplier, 1 = double-balanced mixer
.param PD_CL=6         ; ZX05-30W-S+ conversion loss, dB
.param PD_LO_NOM=7     ; ZX05-30W-S+ LO level, dBm (Level 7)
.param PD_FLP=100e6    ; phase-detector output low-pass (removes 2f)
* ---- [7] SAMPLE/HOLD + SCALING ----
.param SH_DLY=40n      ; FPGA: sample starts this long after detect
.param SH_WIDTH=40n    ; FPGA: sample window length
.param SH_RON=120      ; ADG1211 on-resistance, ohm (check datasheet)
.param SH_ROFF=1G      ; ADG1211 off-resistance
.param SH_C=100p       ; C0G hold capacitor
.param PD_V0=-0.3372   ; phase-detector volts at F_IF_NOM  (from TEST 6 calibration; redo if you change [5]/[6])
.param OPA_GAIN=19.46  ; op-amp gain, V/V  (from TEST 6 calibration; redo if you change [5]/[6]/VCO)
.param VT_CENTER=7.75  ; VCO tune voltage for F_IF_NOM
.param OPA_VMIN=0      ; op-amp output low rail, V
.param OPA_VMAX=11.5   ; op-amp output high rail, V
.param OPA_GBW=8e6     ; ADA4622 gain-bandwidth, Hz (check) - sets tune settling
* ---- [9] VCO + MORSE KEYING ----
.param VCO_V1=6            ; CVCO55BE tune point 1, V
.param VCO_F1=1.0e9        ; ... frequency at VCO_V1
.param VCO_V2=9.5          ; CVCO55BE tune point 2, V
.param VCO_F2=1.2e9        ; ... frequency at VCO_V2
.param VCO_FMIN=0.8e9      ; VCO lower limit
.param VCO_FMAX=1.6e9      ; VCO upper limit
.param P_VCO=3             ; VCO output power, dBm (check datasheet)
.param MORSE_UNIT=60n      ; Morse dot length (SHORTENED for simulation; real racon ~us)
.param MORSE_HOLDOFF=1.6u  ; FPGA delay from detection to first dot
.param KEY_TR=2n           ; ADG901 switching time constant
.param KEY_ISO=40          ; ADG901 off isolation at 1 GHz, dB (check)
.param KEY_IL=1            ; ADG901 insertion loss, dB
* ---- [8] TX RF CHAIN ----
.param IRF_FC=8.2e9  ; image-reject HPF ripple corner (9th-order 0.5 dB Chebyshev ~ VHF-8400+)
.param IRF_IL=1.0    ; image-reject filter extra loss, dB
.param PA_G=30       ; power amp gain, dB (ZVE-143-S+ class - check)
.param PA_P1DB=30    ; power amp output P1dB, dBm (~1 W)
* ---- TEST-BENCH STIMULI ----
.param F_IF_TEST=1.1e9  ; IF test tone (tests 4, 5)
.param P4_START=-35     ; TEST 4: first pulse power at IF splitter input, dBm
.param P4_STEP=10       ; TEST 4: power step per pulse, dB
.param T4_PER=150n      ; TEST 4: pulse period
.param T4_PW=60n        ; TEST 4: pulse width
.param P5_START=-50     ; TEST 5: ramp start at limiter input, dBm
.param P5_STOP=5        ; TEST 5: ramp stop, dBm
.param P6=-20           ; TEST 6: tone power at limiter input, dBm
.param F6_START=1.0e9   ; TEST 6: staircase start
.param F6_STEP=10e6     ; TEST 6: staircase step
.param T6_STEP=8n       ; TEST 6: time per step
.param T7_PER=1u        ; TEST 7: sample period
.param T7_PW=100n       ; TEST 7: detect pulse width
.param T7_DV=0.05       ; TEST 7: phase-detector level step, V
.param VT8_START=5      ; TEST 8: tune ramp start, V
.param VT8_STOP=10.5    ; TEST 8: tune ramp stop, V
.backanno
.end